# Altium schematic sheet ESP32_P4.SchDoc
size D; SheetNumber: 5; SheetTotal: 6
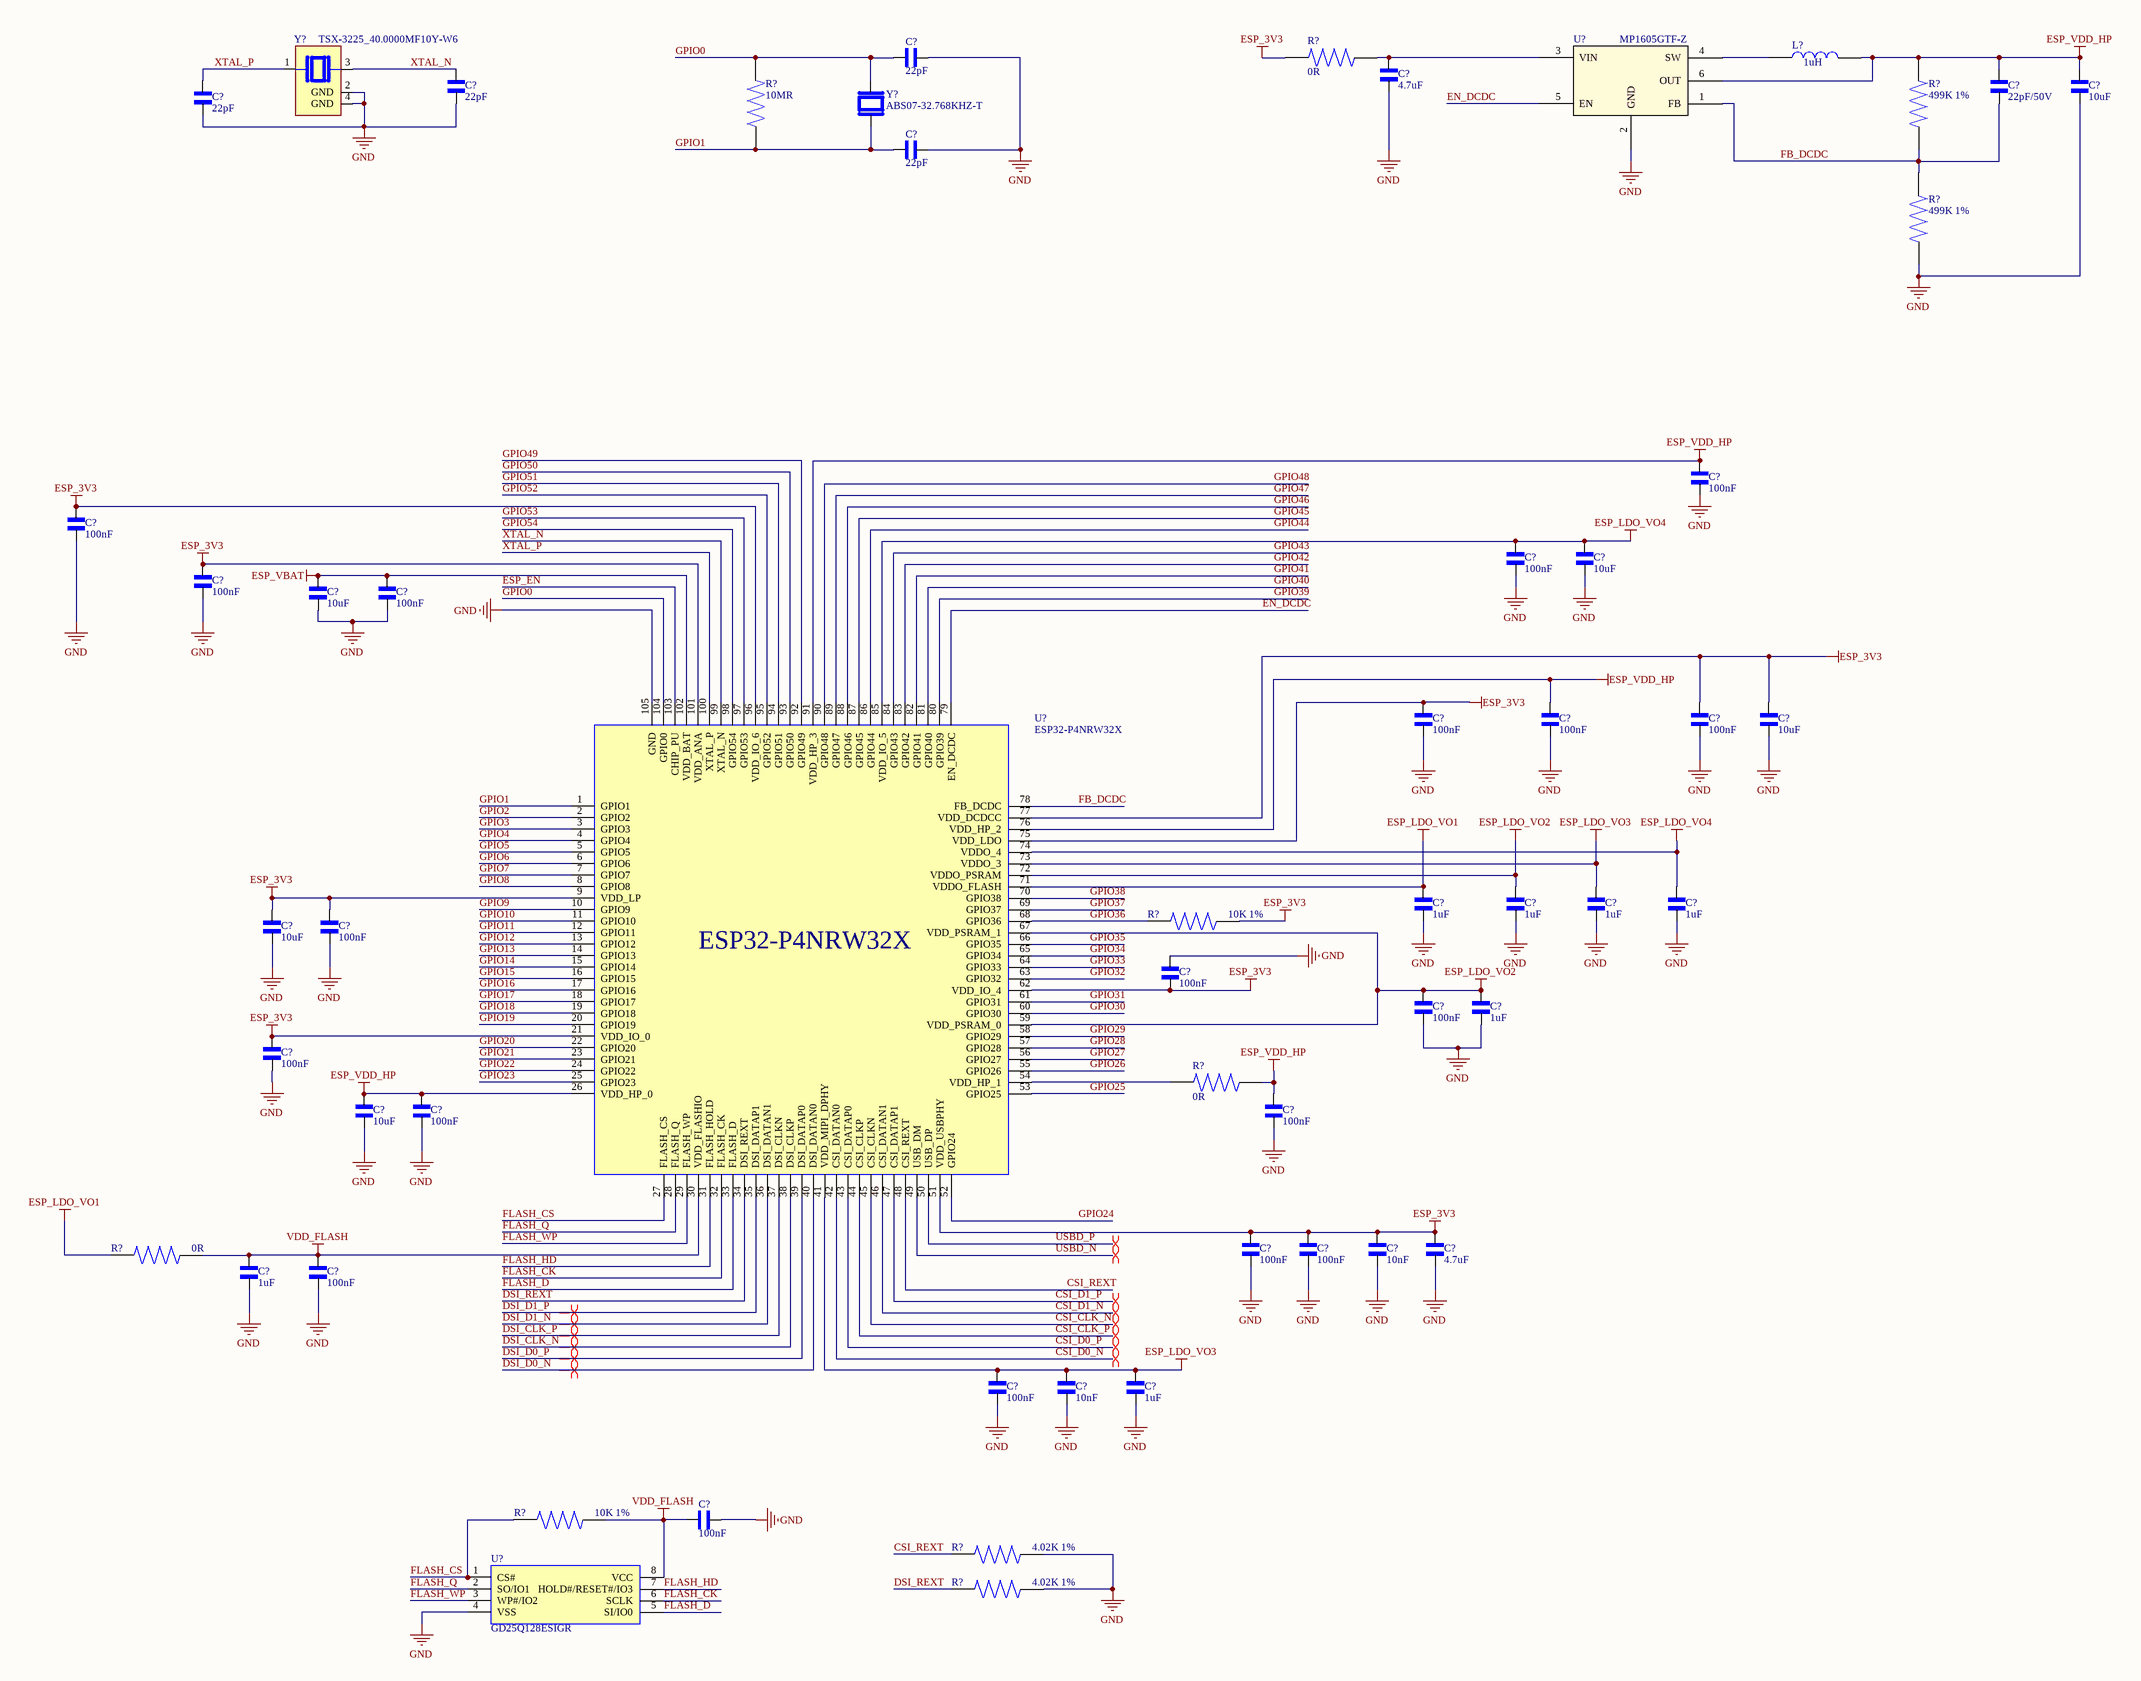
[diagram p0: ESP32_P4.SchDoc]

## Parts
(Parts that share a designator on the sheet are numbered #1, #2 ... from top to bottom, then left to right.)
C?#1  22pF  [CAPC1005X61N]
C?#2  4.7uF  [CAPC1005X61N]
C?#3  22pF/50V  [CAPC1005X61N]
C?#4  10uF  [CAPC1005X61N]
C?#5  22pF  [CAPC1005X61N]
C?#6  22pF  [CAPC1005X61N]
C?#7  22pF  [CAPC1005X61N]
C?#8  100nF  [CAPC1005X61N]
C?#9  100nF  [CAPC1005X61N]
C?#10  100nF  [CAPC1005X61N]
C?#11  10uF  [CAPC1005X61N]
C?#12  100nF  [CAPC1005X61N]
C?#13  10uF  [CAPC1005X61N]
C?#14  100nF  [CAPC1005X61N]
C?#15  100nF  [CAPC1005X61N]
C?#16  100nF  [CAPC1005X61N]
C?#17  100nF  [CAPC1005X61N]
C?#18  10uF  [CAPC1005X61N]
C?#19  1uF  [CAPC1005X61N]
C?#20  1uF  [CAPC1005X61N]
C?#21  1uF  [CAPC1005X61N]
C?#22  1uF  [CAPC1005X61N]
C?#23  10uF  [CAPC1005X61N]
C?#24  100nF  [CAPC1005X61N]
C?#25  100nF  [CAPC1005X61N]
C?#26  100nF  [CAPC1005X61N]
C?#27  1uF  [CAPC1005X61N]
C?#28  100nF  [CAPC1005X61N]
C?#29  10uF  [CAPC1005X61N]
C?#30  100nF  [CAPC1005X61N]
C?#31  100nF  [CAPC1005X61N]
C?#32  100nF  [CAPC1005X61N]
C?#33  100nF  [CAPC1005X61N]
C?#34  10nF  [CAPC1005X61N]
C?#35  4.7uF  [CAPC1005X61N]
C?#36  1uF  [CAPC1005X61N]
C?#37  100nF  [CAPC1005X61N]
C?#38  100nF  [CAPC1005X61N]
C?#39  10nF  [CAPC1005X61N]
C?#40  1uF  [CAPC1005X61N]
C?#41  100nF  [CAPC1005X61N]
L?  1uH  [INDC2016X100N]
R?#1  0R  [RES_ERJU02F5102X]
R?#2  10MR  [RES_ERJU02F5102X]
R?#3  499K 1%  [RES_ERJU02F5102X]
R?#4  499K 1%  [RES_ERJU02F5102X]
R?#5  10K 1%  [RES_ERJU02F5102X]
R?#6  0R  [RES_ERJU02F5102X]
R?#7  0R  [RES_ERJU02F5102X]
R?#8  10K 1%  [RES_ERJU02F5102X]
R?#9  4.02K 1%  [RES_ERJU02F5102X]
R?#10  4.02K 1%  [RES_ERJU02F5102X]
U?#1  MP1605GTF-Z  [SOT563_MP1605_MNP]
U?#2  ESP32-P4NRW32X  [ESP32-P4]
U?#3  GD25Q128ESIGR  [SOIC-8_3.9x4.9mm_P1.27mm]
Y?#1  TSX-3225_40.0000MF10Y-W6  [XTAL_TSX-3225_40.0000MF10Y-W6]
Y?#2  ABS07-32.768KHZ-T  [XTAL_ABS07-32.768KHZ-T]

## Nets
ESP_3V3: C?#9.1 C?#12.1 C?#15.1 C?#17.1 C?#18.1 C?#23.1 C?#24.1 C?#25.1 C?#28.1 C?#32.1 C?#33.1 C?#34.1 C?#35.1 R?#1.2 R?#5.1 U?#2.9(VDD_LP) U?#2.21(VDD_IO_0) U?#2.51(VDD_USBPHY) U?#2.62(VDD_IO_4) U?#2.75(VDD_LDO) U?#2.77(VDD_DCDCC) U?#2.96(VDD_IO_6) U?#2.101(VDD_ANA)
ESP_LDO_VO1: C?#19.1 R?#7.2 U?#2.71(VDDO_FLASH)
ESP_LDO_VO2: C?#20.1 C?#26.1 C?#27.1 U?#2.59(VDD_PSRAM_0) U?#2.67(VDD_PSRAM_1) U?#2.72(VDDO_PSRAM)
ESP_LDO_VO3: C?#21.1 C?#38.1 C?#39.1 C?#40.1 U?#2.41(VDD_MIPI_DPHY) U?#2.73(VDDO_3)
ESP_LDO_VO4: C?#10.1 C?#11.1 C?#22.1 U?#2.74(VDDO_4) U?#2.85(VDD_IO_5)
ESP_VBAT: C?#13.1 C?#14.1 U?#2.102(VDD_BAT)
ESP_VDD_HP: C?#3.1 C?#4.1 C?#8.1 C?#16.1 C?#29.1 C?#30.1 C?#31.1 L?.2 R?#3.1 R?#6.1 U?#1.6(OUT) U?#2.26(VDD_HP_0) U?#2.76(VDD_HP_2) U?#2.91(VDD_HP_3)
GND: C?#1.1 C?#2.2 C?#4.2 C?#5.1 C?#6.1 C?#7.1 C?#8.2 C?#9.2 C?#10.2 C?#11.2 C?#12.2 C?#13.2 C?#14.2 C?#15.2 C?#16.2 C?#17.2 C?#18.2 C?#19.2 C?#20.2 C?#21.2 C?#22.2 C?#23.2 C?#24.2 C?#25.2 C?#26.2 C?#27.2 C?#28.2 C?#29.2 C?#30.2 C?#31.2 C?#32.2 C?#33.2 C?#34.2 C?#35.2 C?#36.2 C?#37.2 C?#38.2 C?#39.2 C?#40.2 C?#41.2 R?#4.2 R?#9.1 R?#10.1 U?#1.2(GND) U?#2.105(GND) U?#3.4(VSS) Y?#1.2(GND) Y?#1.4(GND)
VDD_FLASH: C?#36.1 C?#37.1 C?#41.1 R?#7.1 R?#8.1 U?#2.30(VDD_FLASHIO) U?#3.8(VCC)
CSI_CLK_N: U?#2.45(CSI_CLKN)
CSI_CLK_P: U?#2.44(CSI_CLKP)
CSI_D0_N: U?#2.42(CSI_DATAN0)
CSI_D0_P: U?#2.43(CSI_DATAP0)
CSI_D1_N: U?#2.46(CSI_DATAN1)
CSI_D1_P: U?#2.47(CSI_DATAP1)
CSI_REXT: R?#9.2 U?#2.48(CSI_REXT)
DSI_CLK_N: U?#2.38(DSI_CLKP)
DSI_CLK_P: U?#2.37(DSI_CLKN)
DSI_D0_N: U?#2.40(DSI_DATAN0)
DSI_D0_P: U?#2.39(DSI_DATAP0)
DSI_D1_N: U?#2.36(DSI_DATAN1)
DSI_D1_P: U?#2.35(DSI_DATAP1)
DSI_REXT: R?#10.2 U?#2.34(DSI_REXT)
EN_DCDC: U?#1.5(EN) U?#2.79(EN_DCDC)
ESP_EN: U?#2.103(CHIP_PU)
FB_DCDC: C?#3.2 R?#3.2 R?#4.1 U?#1.1(FB) U?#2.78(FB_DCDC)
FLASH_CK: U?#2.32(FLASH_CK) U?#3.6(SCLK)
FLASH_CS: R?#8.2 U?#2.27(FLASH_CS) U?#3.1(CS#)
FLASH_D: U?#2.33(FLASH_D) U?#3.5(SI/IO0)
FLASH_HD: U?#2.31(FLASH_HOLD) U?#3.7(HOLD#/RESET#/IO3)
FLASH_Q: U?#2.28(FLASH_Q) U?#3.2(SO/IO1)
FLASH_WP: U?#2.29(FLASH_WP) U?#3.3(WP#/IO2)
GPIO0: C?#1.2 R?#2.2 U?#2.104(GPIO0) Y?#2.2
GPIO1: C?#7.2 R?#2.1 U?#2.1(GPIO1) Y?#2.1
GPIO2: U?#2.2(GPIO2)
GPIO3: U?#2.3(GPIO3)
GPIO4: U?#2.4(GPIO4)
GPIO5: U?#2.5(GPIO5)
GPIO6: U?#2.6(GPIO6)
GPIO7: U?#2.7(GPIO7)
GPIO8: U?#2.8(GPIO8)
GPIO9: U?#2.10(GPIO9)
GPIO10: U?#2.11(GPIO10)
GPIO11: U?#2.12(GPIO11)
GPIO12: U?#2.13(GPIO12)
GPIO13: U?#2.14(GPIO13)
GPIO14: U?#2.15(GPIO14)
GPIO15: U?#2.16(GPIO15)
GPIO16: U?#2.17(GPIO16)
GPIO17: U?#2.18(GPIO17)
GPIO18: U?#2.19(GPIO18)
GPIO19: U?#2.20(GPIO19)
GPIO20: U?#2.22(GPIO20)
GPIO21: U?#2.23(GPIO21)
GPIO22: U?#2.24(GPIO22)
GPIO23: U?#2.25(GPIO23)
GPIO24: U?#2.52(GPIO24)
GPIO25: U?#2.53(GPIO25)
GPIO26: U?#2.55(GPIO26)
GPIO27: U?#2.56(GPIO27)
GPIO28: U?#2.57(GPIO28)
GPIO29: U?#2.58(GPIO29)
GPIO30: U?#2.60(GPIO30)
GPIO31: U?#2.61(GPIO31)
GPIO32: U?#2.63(GPIO32)
GPIO33: U?#2.64(GPIO33)
GPIO34: U?#2.65(GPIO34)
GPIO35: U?#2.66(GPIO35)
GPIO36: R?#5.2 U?#2.68(GPIO36)
GPIO37: U?#2.69(GPIO37)
GPIO38: U?#2.70(GPIO38)
GPIO39: U?#2.80(GPIO39)
GPIO40: U?#2.81(GPIO40)
GPIO41: U?#2.82(GPIO41)
GPIO42: U?#2.83(GPIO42)
GPIO43: U?#2.84(GPIO43)
GPIO44: U?#2.86(GPIO44)
GPIO45: U?#2.87(GPIO45)
GPIO46: U?#2.88(GPIO46)
GPIO47: U?#2.89(GPIO47)
GPIO48: U?#2.90(GPIO48)
GPIO49: U?#2.92(GPIO49)
GPIO50: U?#2.93(GPIO50)
GPIO51: U?#2.94(GPIO51)
GPIO52: U?#2.95(GPIO52)
GPIO53: U?#2.97(GPIO53)
GPIO54: U?#2.98(GPIO54)
USBD_N: U?#2.49(USB_DM)
USBD_P: U?#2.50(USB_DP)
XTAL_N: C?#5.2 U?#2.99(XTAL_N) Y?#1.3
XTAL_P: C?#6.2 U?#2.100(XTAL_P) Y?#1.1
NetC?#2_1: C?#2.1 R?#1.1 U?#1.3(VIN)
NetL?_1: L?.1 U?#1.4(SW)
NetR?#6_2: R?#6.2 U?#2.54(VDD_HP_1)

## Layout directives
differential pair: CSI_CLK_N, CSI_CLK_P, CSI_D0_N, CSI_D0_P, CSI_D1_N, CSI_D1_P, DSI_CLK_N, DSI_CLK_P, DSI_D0_N, DSI_D0_P, DSI_D1_N, DSI_D1_P, USBD_N, USBD_P

## Library data of the parts
C?#1-C?#41 = cap_0402_VJ0402D100MXCAP: cap 0402; MF: Vishay Vitramon; SnapEDA_Link: https://www.snapeda.com/parts/VJ0402D100MXCAP/Vishay/view-part/?ref=snap; Package: 1005 Vishay Vitramon; Value: *; MP: VJ0402D100MXCAP; Check_prices: https://www.snapeda.com/parts/VJ0402D100MXCAP/Vishay/view-part/?ref=eda
L? = CIGT201610EH1R0MNE: RF Inductors - SMD CIGT,Thin Film,0806,1.0uH,1.0?,7 embossed,-20 20%; Manufacturer_Name: SAMSUNG; Geometry.Height: 1mm; Manufacturer_Part_Number: CIGT201610EH1R0MNE; Mouser Part Number: 187-CIGT201610EH1R0M; Mouser Price/Stock: https://www.mouser.co.uk/ProductDetail/Samsung-Electro-Mechanics/CIGT201610EH1R0MNE?qs=xZ%2FP%252Ba9zWqaBrqhkAlUALQ%3D%3D; Arrow Part Number: CIGT201610EH1R0MNE; Arrow Price/Stock: https://www.arrow.com/en/products/cigt201610eh1r0mne/samsung-electro-mechanics?region=nac; Datasheet Link: https://www.mouser.com/ProductDetail/Samsung-Electro-Mechanics/CIGT201610EH1R0MNE?qs=xZ%2FP%252Ba9zWqaBrqhkAlUALQ%3D%3D&utm_id=22030780983&gad_source=1&gclid=EAIaIQobChMIvLSdy--WiwMVck1HAR1lcz2jEAAYAyAAEgL_IvD_BwE
R?#1-R?#10 = res_0402_ERJU02F5102X: Availability: Unavailable; MP: ERJU02F5102X; Price: None; Package: None; Value: *
U?#1 = MP1605GTF-Z: 2A 5.5V 2.2MHz Synchronous Step-Down Converter with Low11&micro;A Quiescent Current in SOT563 Package; Manufacturer_Name: Monolithic Power Systems; Copyright: Copyright (C) 2025 Ultra Librarian. All rights reserved.; Manufacturer_Part_Number: MP1605GTF-Z; RefDes: RefDes; Type: Type
U?#2 = ESP32-P4NRW32X: Manufacturer: Espressif Systems; Value: ESP32-P4NRW32X; MPN: ESP32-P4NRW32X; Mouser Part #: 356-ESP32-P4NRW32X; DigiKey Part #: 1965-ESP32-P4NRW32XTR-ND; Manufacturer Part Number: ESP32-P4NRW32X
U?#3 = GD25Q128ESIGR: Manufacturer: GigaDevice Semicon Beijing; Value: GD25Q128ESIGR; MPN: GD25Q128ESIGR; LCSC Part #: C2928891; Manufacturer Part Number: GD25Q128ESIGR
Y?#1 = TSX-3225_40.0000MF10Y-W6: 40 MHz Â±10ppm Crystal 12pF 40 Ohms 4-SMD, No Lead; MP: TSX-3225 40.0000MF10Y-W6; MF: EPSON; Check_prices: https://www.snapeda.com/parts/TSX-3225%2040.0000MF10Y-W6/EPSON/view-part/?ref=eda; Price: None; Purchase-URL: https://pricing.snapeda.com/search/part/TSX-3225 40.0000MF10Y-W6/?ref=eda; SnapEDA_Link: https://www.snapeda.com/parts/TSX-3225%2040.0000MF10Y-W6/EPSON/view-part/?ref=snap; Availability: In Stock; Package: NON STANDARD-4 EPSON; Value: *
Y?#2 = ABS07-32.768KHZ-T: 32.768 kHz Â±20ppm Crystal 12.5pF 70 kOhms 2-SMD, No Lead; MF: Abracon; Availability: In Stock; SnapEDA_Link: https://www.snapeda.com/parts/ABS07-32.768KHZ-T/Abracon+LLC/view-part/?ref=snap; MP: ABS07-32.768KHZ-T; Price: None; Value: *; Check_prices: https://www.snapeda.com/parts/ABS07-32.768KHZ-T/Abracon+LLC/view-part/?ref=eda; Purchase-URL: https://pricing.snapeda.com/search/part/ABS07-32.768KHZ-T/?ref=eda; Package: SMD-2 Abracon LLC